# Altium schematic sheet shema.SchDoc: Study Tracker
size A4; DrawnBy: David Mihić; Revision: 2; SheetNumber: 1; SheetTotal: 1
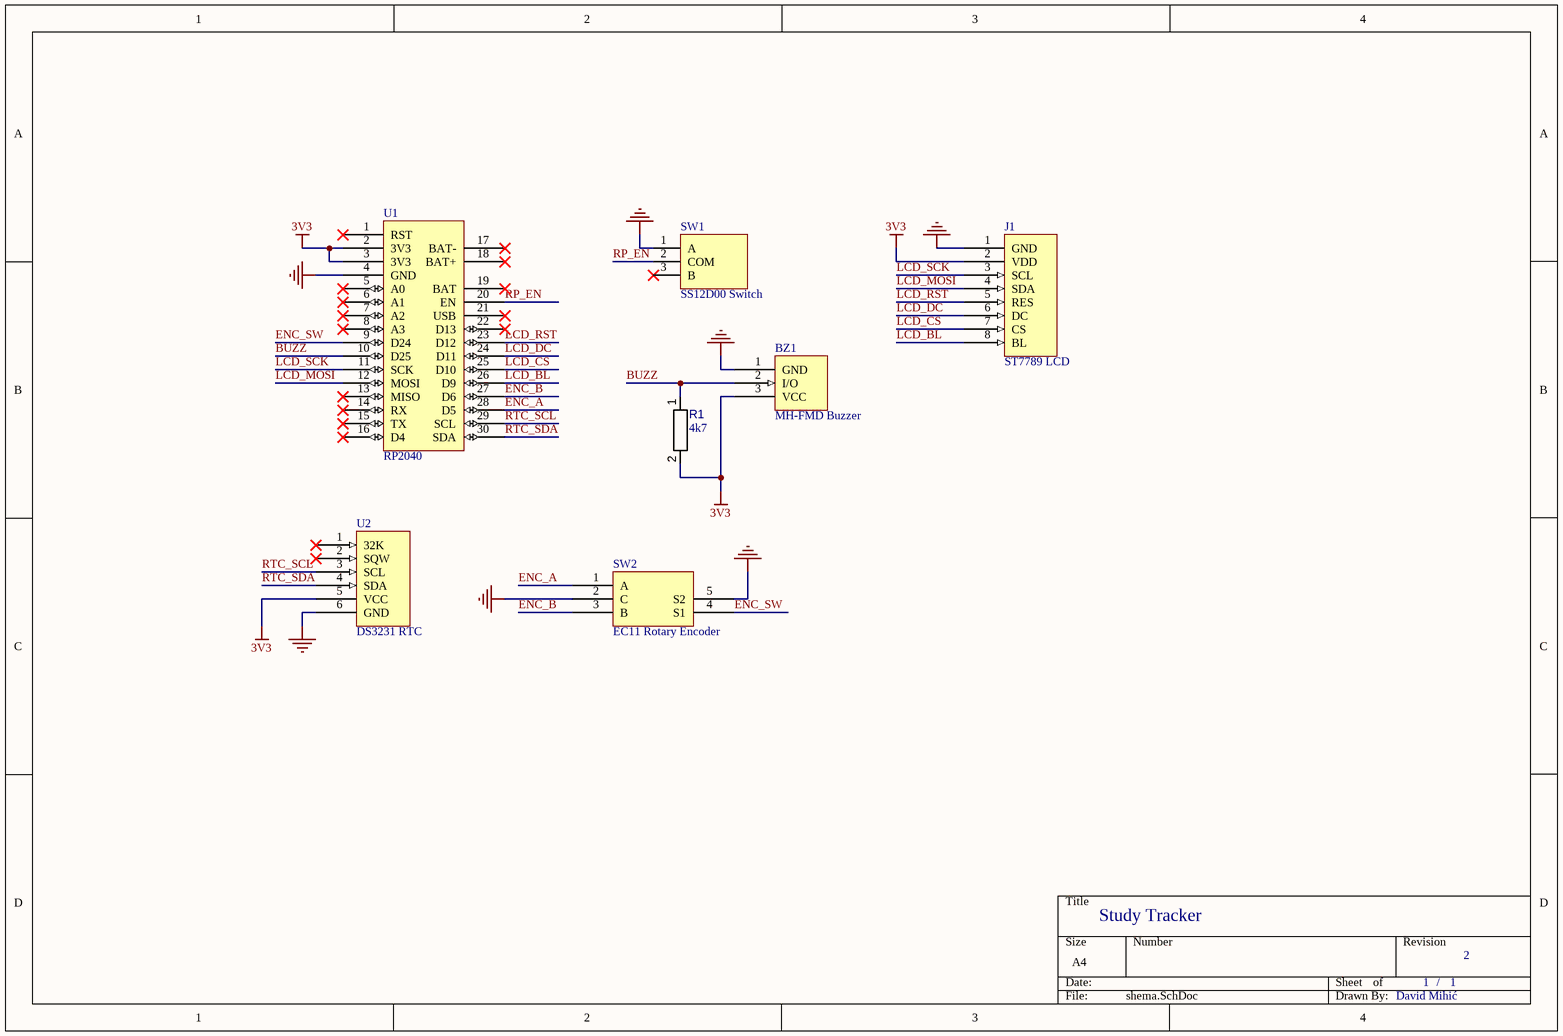
[diagram p0: shema.SchDoc]

## Parts
BZ1  MH-FMD Buzzer
J1  ST7789 LCD
R1  value 4k7  [RESC0402(1005)_L]  (hidden comment: Resistor 4K7  +/-1 % 0402 63 mW)
SW1  SS12D00 Switch  [SS12D00G3]
SW2  EC11 Rotary Encoder
U1  RP2040
U2  DS3231 RTC

## Nets
3V3: BZ1.3(VCC) J1.2(VDD) R1.2 U1.2(3V3) U1.3(3V3) U2.5(VCC)
GND: BZ1.1(GND) J1.1(GND) SW1.1(A) SW2.2(C) SW2.5(S2) U1.4(GND) U2.6(GND)
BUZZ: BZ1.2(I/O) R1.1 U1.10(D25)
ENC_A: SW2.1(A) U1.28(D5)
ENC_B: SW2.3(B) U1.27(D6)
ENC_SW: SW2.4(S1) U1.9(D24)
LCD_BL: J1.8(BL) U1.26(D9)
LCD_CS: J1.7(CS) U1.25(D10)
LCD_DC: J1.6(DC) U1.24(D11)
LCD_MOSI: J1.4(SDA) U1.12(MOSI)
LCD_RST: J1.5(RES) U1.23(D12)
LCD_SCK: J1.3(SCL) U1.11(SCK)
RP_EN: SW1.2(COM) U1.20(EN)
RTC_SCL: U1.29(SCL) U2.3(SCL)
RTC_SDA: U1.30(SDA) U2.4(SDA)

Not connected (* = marked no-connect by the designer): SW1 3(B)*; U1 1(RST)* 5(A0)* 6(A1)* 7(A2)* 8(A3)* 13(MISO)* 14(RX)* 15(TX)* 16(D4)* 17(BAT-)* 18(BAT+)* 19(BAT)* 21(USB)* 22(D13)*; U2 1(32K)* 2(SQW)*

## Notes on the sheet
- /

## Library data of the parts
BZ1 = CMP-00030-00001-2: MH-FMD Active Buzzer
J1 = CMP-031-00009-1: ST7789 LCD Display
R1 = CMP-009-00158-5: Chip Resistor, 4,7 kOhms, +/-1 %, 63 mW, -55 to 155 degC, 0402; Tolerance: 1%; Power: 63mW; Min Operating Temperature: -55°C; Max Operating Temperature: 155°C; Case/Package: 0402; Pins: 2
SW1 = SS12D00G3: Switch; Manufacturer_Name: Vimex; Datasheet Link: http://vimex.com/switches/techdocs/SS12D00-tech.pdf; Height: 7mm; Manufacturer_Part_Number: SS12D00G3
SW2 = CMP-00028-00007-1
U1 = CMP-031-00008-2: Adafruit Feather RP2040
U2 = CMP-00023-00003-1: DS3231 AT24C32 RTC Module